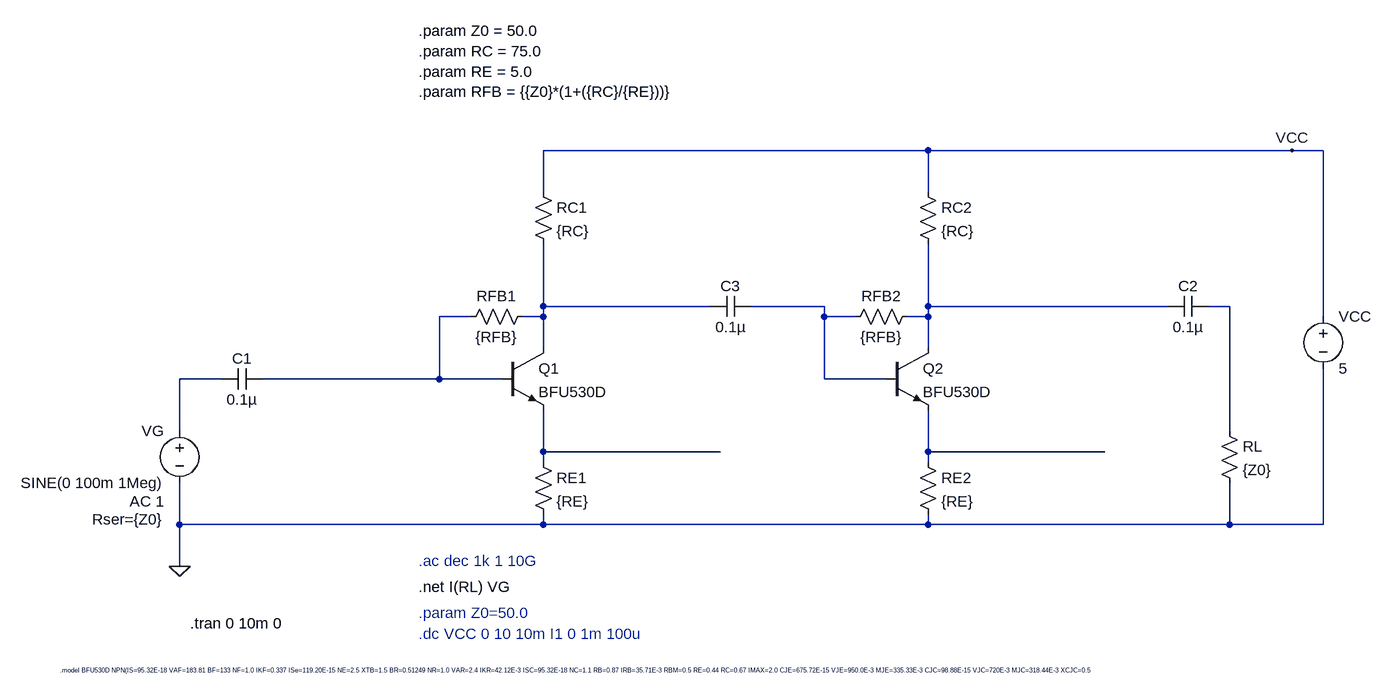
[diagram p0: schematic Shunt_Shunt_RF_Gain_Block_Test_Bench.asc]
Shunt_Shunt_RF_Gain_Block_Test_Bench.asc, the LTspice schematic file:
Version 4.1
SHEET 1 5052 1700
WIRE 1200 48 608 48
WIRE 1760 48 1200 48
WIRE 1808 48 1760 48
WIRE 608 112 608 48
WIRE 1200 112 1200 48
WIRE 608 288 608 192
WIRE 864 288 608 288
WIRE 1040 288 928 288
WIRE 1200 288 1200 192
WIRE 1568 288 1200 288
WIRE 1664 288 1632 288
WIRE 496 304 448 304
WIRE 608 304 608 288
WIRE 608 304 576 304
WIRE 1040 304 1040 288
WIRE 1088 304 1040 304
WIRE 1200 304 1200 288
WIRE 1200 304 1168 304
WIRE 1808 304 1808 48
WIRE 608 352 608 304
WIRE 1200 352 1200 304
WIRE 112 400 48 400
WIRE 448 400 448 304
WIRE 448 400 176 400
WIRE 544 400 448 400
WIRE 1040 400 1040 304
WIRE 1136 400 1040 400
WIRE 48 480 48 400
WIRE 1664 480 1664 288
WIRE 608 512 608 448
WIRE 880 512 608 512
WIRE 1200 512 1200 448
WIRE 1472 512 1200 512
WIRE 608 528 608 512
WIRE 1200 528 1200 512
WIRE 48 624 48 560
WIRE 608 624 608 608
WIRE 608 624 48 624
WIRE 1200 624 1200 608
WIRE 1200 624 608 624
WIRE 1664 624 1664 560
WIRE 1664 624 1200 624
WIRE 1808 624 1808 384
WIRE 1808 624 1664 624
WIRE 48 688 48 624
FLAG 48 688 0
FLAG 1760 48 VCC
DATAFLAG 736 288 ""
DATAFLAG 800 512 ""
DATAFLAG 352 400 ""
DATAFLAG 1328 288 ""
DATAFLAG 1392 512 ""
SYMBOL voltage 1808 288 R0
WINDOW 123 0 0 Left 0
WINDOW 39 0 0 Left 0
SYMATTR InstName VCC
SYMATTR Value 5
SYMBOL npn 544 352 R0
SYMATTR InstName Q1
SYMATTR Value BFU530D
SYMBOL res 592 512 R0
SYMATTR InstName RE1
SYMATTR Value {RE}
SYMBOL res 592 96 R0
SYMATTR InstName RC1
SYMATTR Value {RC}
SYMBOL voltage 48 464 M0
WINDOW 123 24 124 Left 2
WINDOW 39 24 152 Left 2
SYMATTR Value2 AC 1
SYMATTR SpiceLine Rser={Z0}
SYMATTR InstName VG
SYMATTR Value SINE(0 100m 1Meg)
SYMBOL cap 112 416 R270
WINDOW 0 32 32 VTop 2
WINDOW 3 0 32 VBottom 2
SYMATTR InstName C1
SYMATTR Value 0.1µ
SYMBOL cap 1632 304 M270
WINDOW 0 32 32 VTop 2
WINDOW 3 0 32 VBottom 2
SYMATTR InstName C2
SYMATTR Value 0.1µ
SYMBOL res 1648 464 R0
SYMATTR InstName RL
SYMATTR Value {Z0}
SYMBOL res 480 320 R270
WINDOW 0 32 56 VTop 2
WINDOW 3 0 56 VBottom 2
SYMATTR InstName RFB1
SYMATTR Value {RFB}
SYMBOL npn 1136 352 R0
SYMATTR InstName Q2
SYMATTR Value BFU530D
SYMBOL res 1184 512 R0
SYMATTR InstName RE2
SYMATTR Value {RE}
SYMBOL res 1184 96 R0
SYMATTR InstName RC2
SYMATTR Value {RC}
SYMBOL res 1072 320 R270
WINDOW 0 32 56 VTop 2
WINDOW 3 0 56 VBottom 2
SYMATTR InstName RFB2
SYMATTR Value {RFB}
SYMBOL cap 928 304 M270
WINDOW 0 32 32 VTop 2
WINDOW 3 0 32 VBottom 2
SYMATTR InstName C3
SYMATTR Value 0.1µ
TEXT 416 792 Left 2 ;.dc VCC 0 10 10m I1 0 1m 100u
TEXT -136 848 Left 0 !.model BFU530D NPN(IS=95.32E-18 VAF=183.81 BF=133 NF=1.0 IKF=0.337 ISe=119.20E-15 NE=2.5 XTB=1.5 BR=0.51249 NR=1.0 VAR=2.4 IKR=42.12E-3 ISC=95.32E-18 NC=1.1 RB=0.87 IRB=35.71E-3 RBM=0.5 RE=0.44 RC=0.67 IMAX=2.0 CJE=675.72E-15 VJE=950.0E-3 MJE=335.33E-3 CJC=98.88E-15 VJC=720E-3 MJC=318.44E-3 XCJC=0.5 FC=850.0E-3 TF=10.04E-12 XTF=10.0 VTF=1.0 ITF=56.74E-3 PTF=0.0 TR=0.0 KF=109.67E-12 AF=2.0)
TEXT 416 760 Left 2 ;.param Z0=50.0
TEXT 416 720 Left 2 !.net I(RL) VG
TEXT 416 680 Left 2 ;.ac dec 1k 1 10G
TEXT 64 776 Left 2 !.tran 0 10m 0
TEXT 416 -136 Left 2 !.param Z0 = 50.0\n.param RC = 75.0\n.param RE = 5.0\n.param RFB = {{Z0}*(1+({RC}/{RE}))}

The netlist it stands for:
* Shunt_Shunt_RF_Gain_Block_Test_Bench.asc
VCC VCC 0 5
Q1 N001 N005 N007 0 BFU530D
RE1 N007 0 {RE}
RC1 VCC N001 {RC}
VG N006 0 SINE(0 100m 1Meg) AC 1 Rser={Z0}
C1 N006 N005 0.1µ
C2 N004 N003 0.1µ
RL N004 0 {Z0}
RFB1 N005 N001 {RFB}
Q2 N003 N002 N008 0 BFU530D
RE2 N008 0 {RE}
RC2 VCC N003 {RC}
RFB2 N002 N003 {RFB}
C3 N002 N001 0.1µ
.model NPN NPN
.model PNP PNP
.lib standard.bjt
* .dc VCC 0 10 10m I1 0 1m 100u
.model BFU530D NPN(IS=95.32E-18 VAF=183.81 BF=133 NF=1.0 IKF=0.337 ISe=119.20E-15 NE=2.5 XTB=1.5 BR=0.51249 NR=1.0 VAR=2.4 IKR=42.12E-3 ISC=95.32E-18 NC=1.1 RB=0.87 IRB=35.71E-3 RBM=0.5 RE=0.44 RC=0.67 IMAX=2.0 CJE=675.72E-15 VJE=950.0E-3 MJE=335.33E-3 CJC=98.88E-15 VJC=720E-3 MJC=318.44E-3 XCJC=0.5 FC=850.0E-3 TF=10.04E-12 XTF=10.0 VTF=1.0 ITF=56.74E-3 PTF=0.0 TR=0.0 KF=109.67E-12 AF=2.0)
* .param Z0=50.0
.net I(RL) VG
* .ac dec 1k 1 10G
.tran 0 10m 0
.param Z0 = 50.0
.param RC = 75.0
.param RE = 5.0
.param RFB = {{Z0}*(1+({RC}/{RE}))}
.backanno
.end